# Altium schematic sheet PMIC.SchDoc
size A4; SheetNumber: 6; SheetTotal: 6
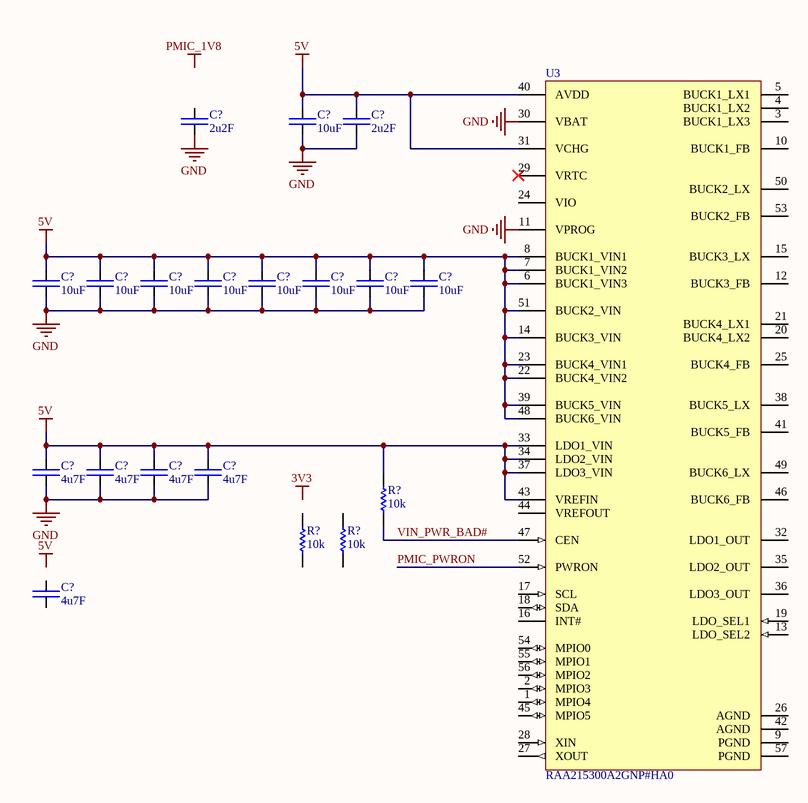
[diagram p0: PMIC.SchDoc]

## Parts
(Parts that share a designator on the sheet are numbered #1, #2 ... from top to bottom, then left to right.)
C?#1  2u2F  [CAP-0805]
C?#2  10uF  [CAP-1206]
C?#3  2u2F  [CAP-0805]
C?#4  10uF  [CAP-1206]
C?#5  10uF  [CAP-1206]
C?#6  10uF  [CAP-1206]
C?#7  10uF  [CAP-1206]
C?#8  10uF  [CAP-1206]
C?#9  10uF  [CAP-1206]
C?#10  10uF  [CAP-1206]
C?#11  10uF  [CAP-1206]
C?#12  4u7F  [CAP-0805]
C?#13  4u7F  [CAP-0805]
C?#14  4u7F  [CAP-0805]
C?#15  4u7F  [CAP-0805]
C?#16  4u7F  [CAP-0805]
R?#1  10k  [RES-0603]
R?#2  10k  [RES-0603]
R?#3  10k  [RES-0603]
U3  RAA215300A2GNP#HA0  [L56_8x8I_MFG]

## Nets
5V: C?#2.2 C?#3.2 C?#4.2 C?#5.2 C?#6.2 C?#7.2 C?#8.2 C?#9.2 C?#10.2 C?#11.2 C?#12.2 C?#13.2 C?#14.2 C?#15.2 R?#1.2 U3.6(BUCK1_VIN3) U3.7(BUCK1_VIN2) U3.8(BUCK1_VIN1) U3.14(BUCK3_VIN) U3.22(BUCK4_VIN2) U3.23(BUCK4_VIN1) U3.31(VCHG) U3.33(LDO1_VIN) U3.34(LDO2_VIN) U3.37(LDO3_VIN) U3.39(BUCK5_VIN) U3.40(AVDD) U3.43(VREFIN) U3.48(BUCK6_VIN) U3.51(BUCK2_VIN)
GND: C?#1.1 C?#2.1 C?#3.1 C?#4.1 C?#5.1 C?#6.1 C?#7.1 C?#8.1 C?#9.1 C?#10.1 C?#11.1 C?#12.1 C?#13.1 C?#14.1 C?#15.1 U3.11(VPROG) U3.30(VBAT)
PMIC_PWRON: U3.52(PWRON)
VIN_PWR_BAD#: R?#1.1 U3.47(CEN)

Not connected (* = marked no-connect by the designer): C?#1 2; C?#16 1 2; R?#2 1 2; R?#3 1 2; U3 1(MPIO4) 2(MPIO3) 3(BUCK1_LX3) 4(BUCK1_LX2) 5(BUCK1_LX1) 9(PGND) 10(BUCK1_FB) 12(BUCK3_FB) 13(LDO_SEL2) 15(BUCK3_LX) 16(INT#) 17(SCL) 18(SDA) 19(LDO_SEL1) 20(BUCK4_LX2) 21(BUCK4_LX1) 24(VIO) 25(BUCK4_FB) 26(AGND) 27(XOUT) 28(XIN) 29(VRTC)* 32(LDO1_OUT) 35(LDO2_OUT) 36(LDO3_OUT) 38(BUCK5_LX) 41(BUCK5_FB) 42(AGND) 44(VREFOUT) 45(MPIO5) 46(BUCK6_FB) 49(BUCK6_LX) 50(BUCK2_LX) 53(BUCK2_FB) 54(MPIO0) 55(MPIO1) 56(MPIO2) 57(PGND)

## Notes on the sheet
- Labels drawn without touching a wire or pin: 3V3, 5V, PMIC_1V8

## Library data of the parts
C?#1 C?#3 C?#12-C?#16 = CAP-0805: Capacitor chip unpolarized. 0805
C?#2 C?#4-C?#11 = CAP-1206: Capacitor chip unpolarized. 1206
R?#1-R?#3 = RES-0603: Resistor chip. 0603
U3 = CMP-00572-119775525-1: Power Management Specialized - PMIC RAA215300A2GNP#HA0 9-Channel PMIC with RTC 56L QFN; Manufacturer Lifecycle Status: ACTIVE; Max Supply Voltage: 5.5V; Min Supply Voltage: 2.7V; Max Supply Current: 4.8mA; Threshold Voltage: 2.1V; Number of Circuits: 1; Pitch: 500µm; Nominal Supply Voltage (DC): 5V; Number of Channels: 9; Harmonized Tariff Schedule (HTS) Code: 8540000000; Introduction Date: 2022-04-01; HelpURL: https://octopart.com/cad-content/api/get-model-datasheet/15189/119775525; ComponentLink2URL: https://octopart.com/cad-content/api/get-model-datasheet/15189/119775525; MSL: 3; Height - Seated (Max): 1mm; ComponentLink3Description: Manufacturer's Package Drawing; Height: 950µm; Part Family: RAA215300; Min Operating Temperature: -40°C; ComponentLink2Description: Datasheet URL; ComponentLink1Description: Manufacturer's Website; Width: 8mm; Lifecycle Status: Production; Package Quantity: 0; Export Control Classification Number (ECCN) Code: EAR99; REACH SVHC: Yes; Number of Terminals: 56; RoHS: Compliant; Max Operating Temperature: 105°C; Number of Pins: 56; Case/Package: QFN; Length: 8mm; Terminal Pitch: 500µm; ComponentLink3URL: https://www.renesas.com/en/document/psc/l568x8i-56-lead-quad-flat-no-lead-plastic-package-5x5mm-exposed-paddle; ComponentLink1URL: http://www.renesas.com